# Altium schematic sheet Button_Encoder_Sheet.SchDoc
size 420 x 297 mm; SheetNumber: 3; SheetTotal: 3
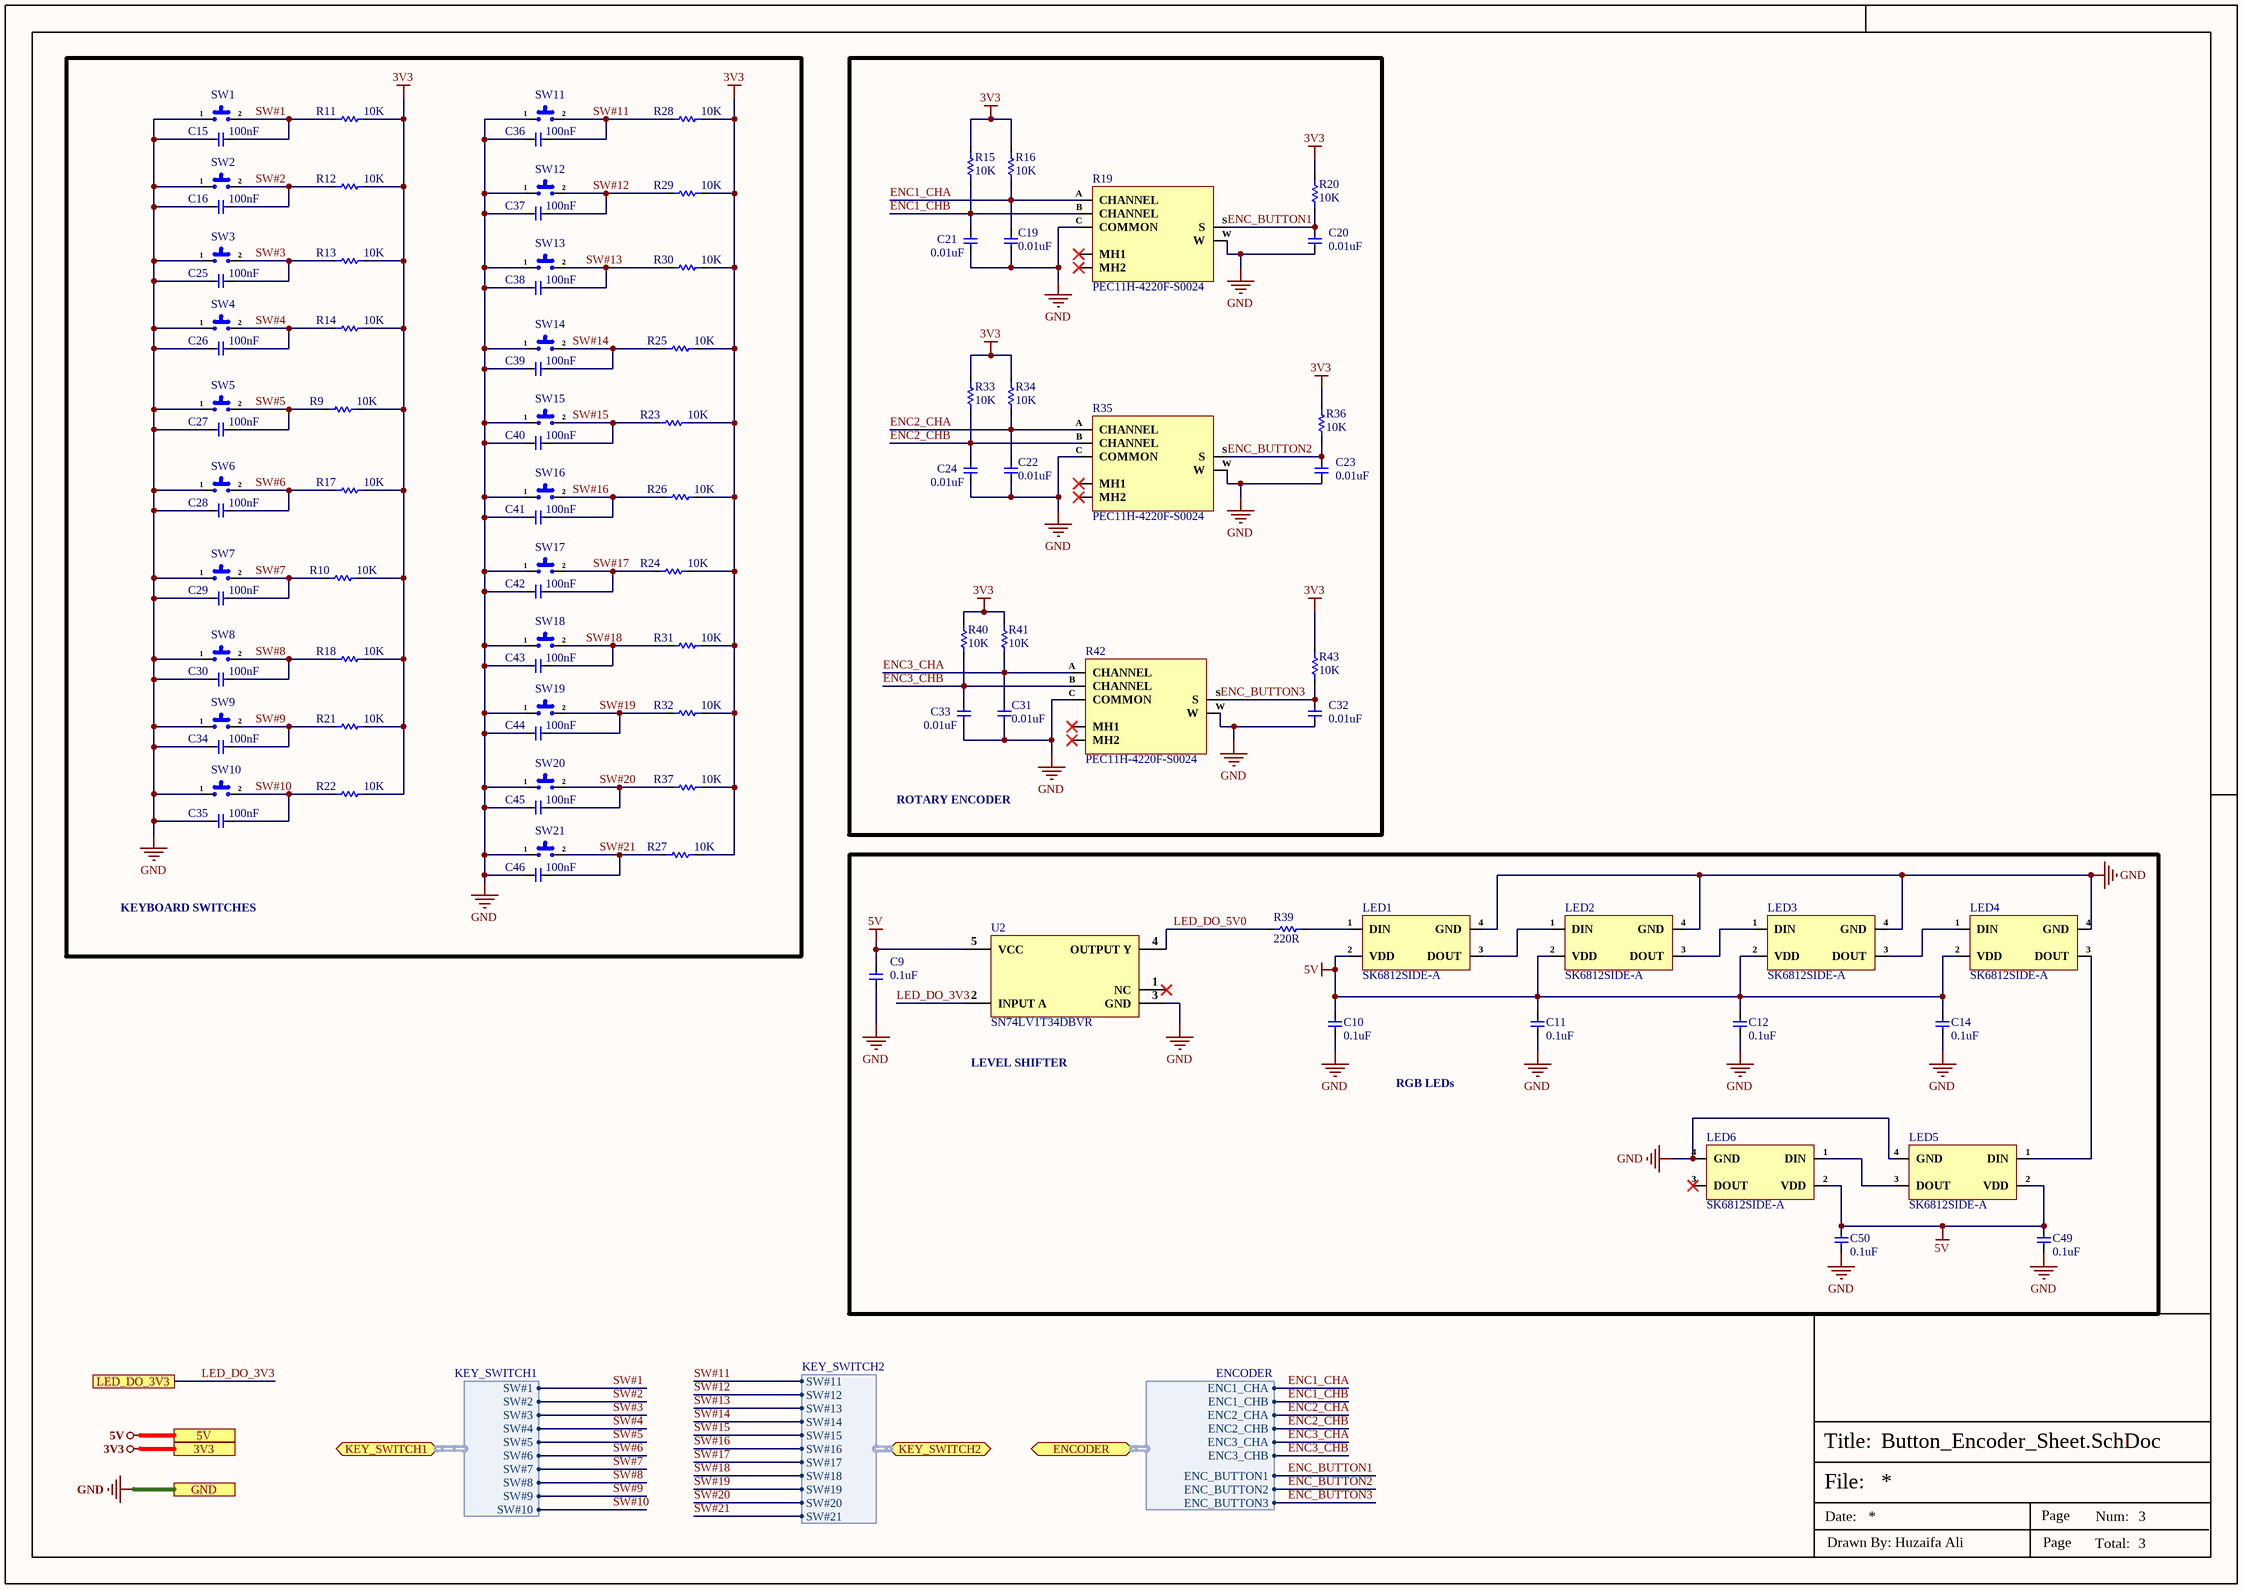
[diagram p0: Button_Encoder_Sheet.SchDoc]

## Parts
C9  0.1uF  [Cap-0402]
C10  0.1uF  [Cap-0402]
C11  0.1uF  [Cap-0402]
C12  0.1uF  [Cap-0402]
C14  0.1uF  [Cap-0402]
C15  100nF  [cap-0402]
C16  100nF  [cap-0402]
C19  0.01uF  [Cap-0402]
C20  0.01uF  [Cap-0402]
C21  0.01uF  [Cap-0402]
C22  0.01uF  [Cap-0402]
C23  0.01uF  [Cap-0402]
C24  0.01uF  [Cap-0402]
C25  100nF  [cap-0402]
C26  100nF  [cap-0402]
C27  100nF  [cap-0402]
C28  100nF  [cap-0402]
C29  100nF  [cap-0402]
C30  100nF  [cap-0402]
C31  0.01uF  [Cap-0402]
C32  0.01uF  [Cap-0402]
C33  0.01uF  [Cap-0402]
C34  100nF  [cap-0402]
C35  100nF  [cap-0402]
C36  100nF  [cap-0402]
C37  100nF  [cap-0402]
C38  100nF  [cap-0402]
C39  100nF  [cap-0402]
C40  100nF  [cap-0402]
C41  100nF  [cap-0402]
C42  100nF  [cap-0402]
C43  100nF  [cap-0402]
C44  100nF  [cap-0402]
C45  100nF  [cap-0402]
C46  100nF  [cap-0402]
C49  0.1uF  [Cap-0402]
C50  0.1uF  [Cap-0402]
LED1  SK6812SIDE-A  [SK6812SIDE-A]
LED2  SK6812SIDE-A  [SK6812SIDE-A]
LED3  SK6812SIDE-A  [SK6812SIDE-A]
LED4  SK6812SIDE-A  [SK6812SIDE-A]
LED5  SK6812SIDE-A  [SK6812SIDE-A]
LED6  SK6812SIDE-A  [SK6812SIDE-A]
R9  10K  [Res-0402]
R10  10K  [Res-0402]
R11  10K  [Res-0402]
R12  10K  [Res-0402]
R13  10K  [Res-0402]
R14  10K  [Res-0402]
R15  10K  [Res-0402]
R16  10K  [Res-0402]
R17  10K  [Res-0402]
R18  10K  [Res-0402]
R19  PEC11H-4220F-S0024  [PEC11H-4220F-S0024]
R20  10K  [Res-0402]
R21  10K  [Res-0402]
R22  10K  [Res-0402]
R23  10K  [Res-0402]
R24  10K  [Res-0402]
R25  10K  [Res-0402]
R26  10K  [Res-0402]
R27  10K  [Res-0402]
R28  10K  [Res-0402]
R29  10K  [Res-0402]
R30  10K  [Res-0402]
R31  10K  [Res-0402]
R32  10K  [Res-0402]
R33  10K  [Res-0402]
R34  10K  [Res-0402]
R35  PEC11H-4220F-S0024  [PEC11H-4220F-S0024]
R36  10K  [Res-0402]
R37  10K  [Res-0402]
R39  220R  [Res-0603]
R40  10K  [Res-0402]
R41  10K  [Res-0402]
R42  PEC11H-4220F-S0024  [PEC11H-4220F-S0024]
R43  10K  [Res-0402]
SW1  CPG151101S11-16  [CPG151101S11-16]  (value not drawn)
SW2  CPG151101S11-16  [CPG151101S11-16]  (value not drawn)
SW3  CPG151101S11-16  [CPG151101S11-16]  (value not drawn)
SW4  CPG151101S11-16  [CPG151101S11-16]  (value not drawn)
SW5  CPG151101S11-16  [CPG151101S11-16]  (value not drawn)
SW6  CPG151101S11-16  [CPG151101S11-16]  (value not drawn)
SW7  CPG151101S11-16  [CPG151101S11-16]  (value not drawn)
SW8  CPG151101S11-16  [CPG151101S11-16]  (value not drawn)
SW9  CPG151101S11-16  [CPG151101S11-16]  (value not drawn)
SW10  CPG151101S11-16  [CPG151101S11-16]  (value not drawn)
SW11  CPG151101S11-16  [CPG151101S11-16]  (value not drawn)
SW12  CPG151101S11-16  [CPG151101S11-16]  (value not drawn)
SW13  CPG151101S11-16  [CPG151101S11-16]  (value not drawn)
SW14  CPG151101S11-16  [CPG151101S11-16]  (value not drawn)
SW15  CPG151101S11-16  [CPG151101S11-16]  (value not drawn)
SW16  CPG151101S11-16  [CPG151101S11-16]  (value not drawn)
SW17  CPG151101S11-16  [CPG151101S11-16]  (value not drawn)
SW18  CPG151101S11-16  [CPG151101S11-16]  (value not drawn)
SW19  CPG151101S11-16  [CPG151101S11-16]  (value not drawn)
SW20  CPG151101S11-16  [CPG151101S11-16]  (value not drawn)
SW21  CPG151101S11-16  [CPG151101S11-16]  (value not drawn)
U2  SN74LV1T34DBVR  [SOT-23-5]

## Blocks framed on the sheet
KEYBOARD SWITCHES: C15 C16 C25-C30 C34-C46 R9-R14 R17 R18 R21-R32 R37 SW1-SW21
ROTARY ENCODER: C19-C24 C31-C33 R15 R16 R19 R20 R33-R36 R40-R43

## Ports
3V3, 5V, ENCODER (bidir, harness ENCODER), GND, KEY_SWITCH1 (bidir, harness KEY_SWITCH1), KEY_SWITCH2 (bidir, harness KEY_SWITCH2), LED_DO_3V3

## Harnesses
KEY_SWITCH2: SW#11, SW#12, SW#13, SW#14, SW#15, SW#16, SW#17, SW#18, SW#19, SW#20, SW#21
KEY_SWITCH1: SW#1, SW#2, SW#3, SW#4, SW#5, SW#6, SW#7, SW#8, SW#9, SW#10
ENCODER: ENC1_CHA, ENC1_CHB, ENC2_CHA, ENC2_CHB, ENC3_CHA, ENC3_CHB, ENC_BUTTON1, ENC_BUTTON2, ENC_BUTTON3

## Nets
3V3: R9.1 R10.1 R11.1 R12.1 R13.1 R14.1 R15.2 R16.2 R17.1 R18.1 R20.2 R21.1 R22.1 R23.1 R24.1 R25.1 R26.1 R27.1 R28.1 R29.1 R30.1 R31.1 R32.1 R33.2 R34.2 R36.2 R37.1 R40.2 R41.2 R43.2 ; port 3V3
5V: C9.2 C10.2 C11.2 C12.2 C14.2 C49.2 C50.2 LED1.2(VDD) LED2.2(VDD) LED3.2(VDD) LED4.2(VDD) LED5.2(VDD) LED6.2(VDD) U2.5(VCC) ; port 5V
GND: C9.1 C10.1 C11.1 C12.1 C14.1 C15.1 C16.1 C19.1 C20.1 C21.1 C22.1 C23.1 C24.1 C25.1 C26.1 C27.1 C28.1 C29.1 C30.1 C31.1 C32.1 C33.1 C34.1 C35.1 C36.1 C37.1 C38.1 C39.1 C40.1 C41.1 C42.1 C43.1 C44.1 C45.1 C46.1 C49.1 C50.1 LED1.4(GND) LED2.4(GND) LED3.4(GND) LED4.4(GND) LED5.4(GND) LED6.4(GND) R19.C(COMMON) R19.W R35.C(COMMON) R35.W R42.C(COMMON) R42.W SW1.1 SW2.1 SW3.1 SW4.1 SW5.1 SW6.1 SW7.1 SW8.1 SW9.1 SW10.1 SW11.1 SW12.1 SW13.1 SW14.1 SW15.1 SW16.1 SW17.1 SW18.1 SW19.1 SW20.1 SW21.1 U2.3(GND) ; port GND
ENC1_CHA: C19.2 R16.1 R19.A(CHANNEL) ; port ENCODER.ENC1_CHA
ENC1_CHB: C21.2 R15.1 R19.B(CHANNEL) ; port ENCODER.ENC1_CHB
ENC2_CHA: C22.2 R34.1 R35.A(CHANNEL) ; port ENCODER.ENC2_CHA
ENC2_CHB: C24.2 R33.1 R35.B(CHANNEL) ; port ENCODER.ENC2_CHB
ENC3_CHA: C31.2 R41.1 R42.A(CHANNEL) ; port ENCODER.ENC3_CHA
ENC3_CHB: C33.2 R40.1 R42.B(CHANNEL) ; port ENCODER.ENC3_CHB
ENC_BUTTON1: C20.2 R19.S R20.1 ; port ENCODER.ENC_BUTTON1
ENC_BUTTON2: C23.2 R35.S R36.1 ; port ENCODER.ENC_BUTTON2
ENC_BUTTON3: C32.2 R42.S R43.1 ; port ENCODER.ENC_BUTTON3
LED_DO_3V3: U2.2(INPUT_A) ; port LED_DO_3V3
LED_DO_5V0: R39.1 U2.4(OUTPUT_Y)
SW#1: C15.2 R11.2 SW1.2 ; port KEY_SWITCH1.SW#1
SW#2: C16.2 R12.2 SW2.2 ; port KEY_SWITCH1.SW#2
SW#3: C25.2 R13.2 SW3.2 ; port KEY_SWITCH1.SW#3
SW#4: C26.2 R14.2 SW4.2 ; port KEY_SWITCH1.SW#4
SW#5: C27.2 R9.2 SW5.2 ; port KEY_SWITCH1.SW#5
SW#6: C28.2 R17.2 SW6.2 ; port KEY_SWITCH1.SW#6
SW#7: C29.2 R10.2 SW7.2 ; port KEY_SWITCH1.SW#7
SW#8: C30.2 R18.2 SW8.2 ; port KEY_SWITCH1.SW#8
SW#9: C34.2 R21.2 SW9.2 ; port KEY_SWITCH1.SW#9
SW#10: C35.2 R22.2 SW10.2 ; port KEY_SWITCH1.SW#10
SW#11: C36.2 R28.2 SW11.2 ; port KEY_SWITCH2.SW#11
SW#12: C37.2 R29.2 SW12.2 ; port KEY_SWITCH2.SW#12
SW#13: C38.2 R30.2 SW13.2 ; port KEY_SWITCH2.SW#13
SW#14: C39.2 R25.2 SW14.2 ; port KEY_SWITCH2.SW#14
SW#15: C40.2 R23.2 SW15.2 ; port KEY_SWITCH2.SW#15
SW#16: C41.2 R26.2 SW16.2 ; port KEY_SWITCH2.SW#16
SW#17: C42.2 R24.2 SW17.2 ; port KEY_SWITCH2.SW#17
SW#18: C43.2 R31.2 SW18.2 ; port KEY_SWITCH2.SW#18
SW#19: C44.2 R32.2 SW19.2 ; port KEY_SWITCH2.SW#19
SW#20: C45.2 R37.2 SW20.2 ; port KEY_SWITCH2.SW#20
SW#21: C46.2 R27.2 SW21.2 ; port KEY_SWITCH2.SW#21
NetLED1_1: LED1.1(DIN) R39.2
NetLED1_3: LED1.3(DOUT) LED2.1(DIN)
NetLED2_3: LED2.3(DOUT) LED3.1(DIN)
NetLED3_3: LED3.3(DOUT) LED4.1(DIN)
NetLED4_3: LED4.3(DOUT) LED5.1(DIN)
NetLED5_3: LED5.3(DOUT) LED6.1(DIN)

Not connected (* = marked no-connect by the designer): LED6 3(DOUT)*; R19 MH1* MH2*; R35 MH1* MH2*; R42 MH1* MH2*; U2 1(NC)*

## Notes on the sheet
- LEVEL SHIFTER
- RGB LEDs
- File:
- Title:
- Date:
- Page
- Num:
- Total:
- Drawn By: Huzaifa Ali

## Library data of the parts
C9-C12 C14 C49 C50 = GRM155R71E104KE14D: CAP CER 0.1UF 25V X7R 0402; Manufacturer: Murata; Item Type: Capacitors; Dielectric Material: Ceramic; Material: 4241ConductorMaterial; Value: 100nF; Tolerance: 10%; Supplier: Mouser; LCSC Part Number: C77014; Manufacturer Part Number: GRM155R71E104KE14D; RoHS: Yes; Stock: 652368; Pricing: 1=0.1, 10=0.007, 50=0.007, 100=0.005, 1000=0.005, 10000=0.004 (USD); Mounting Technology: Surface Mount; Case/Package: 0402; Pins: 2NUMBER; Case Code (Metric): 1005; Case Code (Imperial): 0402; Weight: 0.000212oz; Min Operating Temperature: -55°C; Max Operating Temperature: 125°C; Packaging: Tape and Reel; Voltage Rating: 25V; Dielectric: X7R; Voltage: 25V; Termination: SMD/SMT; Voltage Rating (DC): 25V; Package Quantity: 10000; Series: GRM; Length: 1mm; Width: 0.02inch; Height: 0.5mm; Thickness: 0.022inch; Depth: 0.5mm; RoHS Compliant: Yes; Reach SVHC Compliant: Unknown; Lead Free: 5697LeadFree; ComponentLink1URL: http://www.farnell.com/datasheets/1872206.pdf?src-supplier=Farnell; ComponentLink1Description: http://www.farnell.com/datasheets/1872206.pdf?src-supplier=Farnell; ComponentLink2URL: http://www.mouser.com/ds/2/281/c02e-2905.pdf?src-supplier=Mouser; ComponentLink2Description: http://www.mouser.com/ds/2/281/c02e-2905.pdf?src-supplier=Mouser; ComponentLink3URL: http://uk.rs-online.com/webdocs/144c/0900766b8144c113.pdf?src-supplier=Rs; ComponentLink3Description: http://uk.rs-online.com/webdocs/144c/0900766b8144c113.pdf?src-supplier=Rs; ComponentLink4URL: https://datasheet.octopart.com/GRM155R71E104KE14D-Murata-datasheet-62346597.pdf?src-supplier=Future+Electronics; ComponentLink4Description: https://datasheet.octopart.com/GRM155R71E104KE14D-Murata-datasheet-62346597.pdf?src-supplier=Future+Electronics; ComponentLink5URL: https://search.murata.co.jp/Ceramy/image/img/A01X/G101/ENG/GRM155R71E104KE14-01.pdf?src-supplier=Digikey; ComponentLink5Description: https://search.murata.co.jp/Ceramy/image/img/A01X/G101/ENG/GRM155R71E104KE14-01.pdf?src-supplier=Digikey; ComponentLink6URL: http://www.farnell.com/datasheets/2048008.pdf?src-supplier=Newark; ComponentLink6Description: http://www.farnell.com/datasheets/2048008.pdf?src-supplier=Newark; ComponentLink7URL: https://datasheet.octopart.com/GRM155R71E104KE14D-Murata-datasheet-62317124.pdf?src-supplier=Element14; ComponentLink7Description: https://datasheet.octopart.com/GRM155R71E104KE14D-Murata-datasheet-62317124.pdf?src-supplier=Element14; ComponentLink8URL: http://psearch.en.murata.com/capacitor/product/GRM155R71E104KE14%23.pdf?src-supplier=Avnet; ComponentLink8Description: http://psearch.en.murata.com/capacitor/product/GRM155R71E104KE14%23.pdf?src-supplier=Avnet
C15 C16 C25-C30 C34-C46 = C1005X7R1H104KT000F: CAP CER 0.1UF 50V X7R 0402; Manufacturer: TDK; Tolerance: 10%; Voltage: 25V; Item Type: Capacitor; Supplier 1: Avnet; Manufacturer Part Number: C1005X7R1H104KT000F; RoHS: No; Category: Ceramic Capacitors; Dielectric: X7R; Supplier Part Number 1: C1005X7R1H104KT000F; LCSC Part Number: C361198; ComponentLink1Description: LCSC; ComponentLink1URL: https://www.lcsc.com/product-detail/Multilayer-Ceramic-Capacitors-MLCC-SMD-SMT_TDK-C1005X7R1H104KT000F_C361198.html
C19-C24 C31-C33 = CC0402KRX5R8BB103: CAP CER 10000PF 25V X5R 0402; Manufacturer: Yageo; Item Type: Capacitor; Supplier 1: Future Electronics; Manufacturer Part Number: CC0402KRX5R8BB103; RoHS: Yes; Category: Ceramic Capacitors; Stock 1: 140000; Pricing 1: 10000=0.00290, 40000=0.00270, 150000=0.00260, 250000=0.00250, 500000=0.00240 (USD); RoHS Compliant: Yes; Supplier Part Number 1: 2101932; LCSC Part Number: C576726; ComponentLink1Description: LCSC; ComponentLink1URL: https://www.lcsc.com/product-detail/Multilayer-Ceramic-Capacitors-MLCC-SMD-SMT_YAGEO-CC0402KRX5R8BB103_C576726.html
LED1-LED6 = SK6812SIDE-A: SMD-4P,1.6x4mm Light Emitting Diodes (LED) ROHS; Manufacturer: OPSCO Optoelectronics; Item type: Addressable RGB LED; ComponentLink1Description: LCSC; ComponentLink1URL: https://www.lcsc.com/product-detail/Light-Emitting-Diodes-LED_OPSCO-Optoelectronics-SK6812SIDE-A_C5378721.html; Manufacturer Part Number: SK6812SIDE-A; Package: SMD-4P,1.6x4mm; LCSC Part Number: C5378721
R9-R18 R20-R34 R36 R37 R40 R41 R43 = RC0402FR-0710KL: RES 10K OHM 1% 1/16W 0402; Manufacturer: Yageo; Resistance: 10kR; Voltage Rating (DC): 50V; Temperature Coefficient: 100ppm/°C; Power Rating: 62.5mW; Max Power Dissipation: 63mW; Item Type: Resistor; Supplier 1: Mouser; Manufacturer Part Number: RC0402FR-0710KL; RoHS: Yes; Category: Chip SMD Resistors; Stock 1: 18648329; Pricing 1: 1=0.10000, 10=0.01400, 50=0.01400, 100=0.00500, 1000=0.00300, 10000=0.00200 (USD); Case/Package: 0402; Number of Pins: 2; Case Code (Imperial): 0402; Case Code (Metric): 1005; Min Operating Temperature: -55°C; Max Operating Temperature: 155°C; Resistor Type: Thick Film; Tolerance: 1%; Packaging: Tape and Reel; Voltage Rating: 50V; Termination: SMD/SMT; Working Voltage: 50V; Number of Terminations: 2; Features: Moisture Resistant; Series: RC; Resistance Tolerance: 1%; Construction: Rectangular; Length: 1mm; Width: 0.5mm; Height: 0.32mm; Depth: 0.5mm; Lead Pitch: 0.2mm; REACH SVHC: No SVHC; Lead Free: Lead Free; RoHS Compliant: Yes; Military Standard: Not; ComponentLink1URL: https://datasheet.ciiva.com/7660/38568-7660787.pdf?src-supplier=Element14; ComponentLink1Description: https://datasheet.ciiva.com/7660/38568-7660787.pdf?src-supplier=Element14; ComponentLink2URL: https://datasheet.ciiva.com/7849/1686128-7849814.pdf?src-supplier=Element14; ComponentLink2Description: https://datasheet.ciiva.com/7849/1686128-7849814.pdf?src-supplier=Element14; ComponentLink3URL: https://datasheet.ciiva.com/7983/1018594-7983486.pdf?src-supplier=Element14; ComponentLink3Description: https://datasheet.ciiva.com/7983/1018594-7983486.pdf?src-supplier=Element14; ComponentLink4URL: https://datasheet.ciiva.com/22747/1018594-22747512.pdf?src-supplier=Element14; ComponentLink4Description: https://datasheet.ciiva.com/22747/1018594-22747512.pdf?src-supplier=Element14; ComponentLink5URL: https://datasheet.ciiva.com/12667/pyu-rc0402-51-rohs-l-6-r-12667067.pdf?src-supplier=Mouser; ComponentLink5Description: https://datasheet.ciiva.com/12667/pyu-rc0402-51-rohs-l-6-r-12667067.pdf?src-supplier=Mouser; ComponentLink6URL: https://datasheet.ciiva.com/7849/1784430-7849813.pdf?src-supplier=Element14; ComponentLink6Description: https://datasheet.ciiva.com/7849/1784430-7849813.pdf?src-supplier=Element14; ComponentLink7URL: https://datasheet.ciiva.com/7849/1784430-7849815.pdf?src-supplier=Element14; ComponentLink7Description: https://datasheet.ciiva.com/7849/1784430-7849815.pdf?src-supplier=Element14; Supplier Part Number 1: 603-RC0402FR-0710KL; LCSC Part Number: C60490
R19 R35 R42 = PEC11H-4220F-S0024: 11mm Encoder with 24 Detent Force 20mm Metal Flatted Shaft PC Pin Horizontal/Rear Facing; Manufacturer: Bourns; Supplier: Digikey; Supplier Part Number: 118-PEC11H-4220F-S0024-ND; Manufacturer Part Number: PEC11H-4220F-S0024; RoHS: No; Stock: 1001; Pricing: 1=3.04, 5=2.746, 10=2.565, 25=2.3516, 75=2.194, 150=2.0646, 300=1.89023, 450=1.77209, 975=1.65958 (USD); Item Type: Encoder; Package: Custom; LCSC Part Number: -; ComponentLink1Description: Digikey; ComponentLink1URL: https://www.digikey.com/en/products/detail/bourns-inc/PEC11H-4220F-S0024/12349532
R39 = RC0603FR-07220RL: RES SMD 220 OHM 1% 1/10W 0603; Manufacturer: Yageo; Temperature Coefficient: 100ppm/°C; Voltage Rating (DC): 50V; Power Rating: 100mW; Item Type: Resistor; Supplier 1: Digi-Key; Manufacturer Part Number: RC0603FR-07220RL; Stock 1: 5843995; Pricing 1: 1=0.1, 10=0.023, 100=0.0094, 1000=0.00421, 2500=0.00366 (USD); Case/Package: 0603; Number of Pins: 2; Case Code (Imperial): 0603; Case Code (Metric): 1608; Min Operating Temperature: -55°C; Max Operating Temperature: 155°C; Resistance: 220R; Tolerance: 1%; Composition: Thick Film; Packaging: Tape and Reel; Voltage Rating: 50V; Package Quantity: 1; Termination: SMD/SMT; Number of Terminations: 2; Military Standard: Not; Max Power Dissipation: 100mW; Features: Moisture Resistant; Length: 1.6mm; Height: 0.022inch; Width: 0.031inch; Depth: 0.8mm; REACH SVHC: No SVHC; Lead Free: Lead Free; ComponentLink1URL: http://www.yageo.com/documents/recent/PYu-RC_Group_51_RoHS_L_10.pdf?src-supplier=Digi-Key; ComponentLink1Description: http://www.yageo.com/documents/recent/PYu-RC_Group_51_RoHS_L_10.pdf?src-supplier=Digi-Key; ComponentLink2URL: http://www.farnell.com/datasheets/1868787.pdf?src-supplier=Element14; ComponentLink2Description: http://www.farnell.com/datasheets/1868787.pdf?src-supplier=Element14; Supplier Part Number 1: 311-220HRCT-ND; LCSC Part Number: C107696
SW1-SW21 = CPG151101S11-16: SMD,14.5x5.9mm Mechanical Keyboard Shaft ROHS; Manufacturer: HanElectricity; Manufacturer Part Number: CPG151101S11-16; Package: SMD,14.5x5.9mm; LCSC Part Number: C41430893; Item Type: Mechanical Keyboard Shaft; ComponentLink1Description: LCSC; ComponentLink1URL: https://www.lcsc.com/product-detail/Mechanical-Keyboard-Shaft_HanElectricity-CPG151101S11-16_C41430893.html?s_z=n_%2520CPG151101S11-16
U2 = SN74LV1T34DBVR: IC BUF NON-INVERT 5.5V SOT23-5; Manufacturer: Texas Instruments; Number of Elements: 1; Logic Function: Buffer,Inverting; High Level Output Current: -8mA; Low Level Output Current: 8mA; Min Supply Voltage: 1.6V; Polarity: Non-Inverting; Propagation Delay: 15.5ns; Quiescent Current: 1uA; Supplier 1: Digi-Key; Manufacturer Part Number: SN74LV1T34DBVR; Stock 1: 37360; Pricing 1: 1=0.43, 10=0.349, 25=0.3192, 100=0.2374, 250=0.2152, 500=0.17808, 1000=0.13356 (USD); Mount: Surface Mount; Case/Package: SOT-23-5; Number of Pins: 5; Weight: 0.000353oz; Min Operating Temperature: -40°C; Max Operating Temperature: 125°C; Packaging: Tape and Reel; Number of Bits per Element: 1; Number of Bits: 1; Package Quantity: 3000; Max Supply Voltage: 5.5V; Number of Input Lines: 1; Number of Output Lines: 1; Operating Supply Current: 8mA; Number of Channels: 1; Number of Inputs: 1; Number of Outputs: 1; Radiation Hardening: No; RoHS Compliant: Yes; REACH SVHC: No SVHC; Lead Free: Lead Free; ComponentLink1URL: http://www.ti.com/lit/pdf/sdyu001?src-supplier=Digi-Key; ComponentLink1Description: http://www.ti.com/lit/pdf/sdyu001?src-supplier=Digi-Key; ComponentLink2URL: http://www.ti.com/lit/ds/symlink/sn74lv1t34.pdf?src-supplier=Avnet; ComponentLink2Description: http://www.ti.com/lit/ds/symlink/sn74lv1t34.pdf?src-supplier=Avnet; Supplier Part Number 1: 296-37176-6-ND; LCSC Part Number: C100024; Item Type: IC